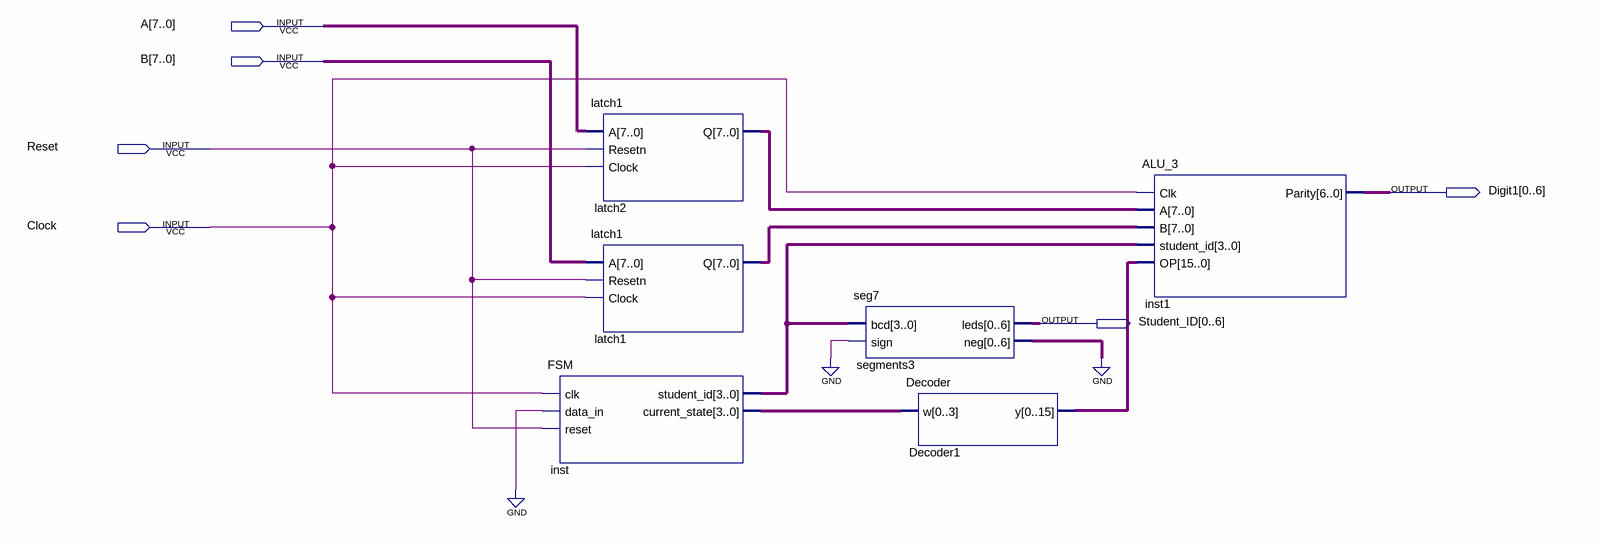
[diagram p0: schematic sheet]
// Quartus schematic Lab6_3.bdf as structural Verilog: 6 symbols, 6 pins
module Lab6_3 (
  input  [7:0] A,
  input  [7:0] B,
  input  Reset,
  input  Clock,
  output [0:6] Digit1,
  output [0:6] Student_ID
);

  wire [3:0] inst_current_state, inst_student_id;
  wire [6:0] segments3_neg;
  wire [7:0] latch1_q, latch2_q;
  wire [15:0] Decoder1_y;

  FSM inst (
    .clk(Clock), .data_in(1'b0), .reset(Reset), .student_id(inst_student_id),
    .current_state(inst_current_state));
  latch1 latch2 (.A(A), .Resetn(Reset), .Clock(Clock), .Q(latch2_q));
  latch1 latch1 (.A(B), .Resetn(Reset), .Clock(Clock), .Q(latch1_q));
  seg7 segments3 (.bcd(inst_student_id), .sign(1'b0), .leds(Student_ID), .neg(segments3_neg));
  Decoder Decoder1 (.w(inst_current_state), .y(Decoder1_y));
  ALU_3 inst1 (.Clk(Clock), .A(latch2_q), .B(latch1_q), .student_id(inst_student_id), .OP(Decoder1_y), .Parity(Digit1));
  // also tied to GND on the sheet: {segments3_neg[0], segments3_neg[1], segments3_neg[2], segments3_neg[3], segments3_neg[4], segments3_neg[5], segments3_neg[6]}
endmodule
